# Altium schematic sheet 5_can.SchDoc
size A4; SheetNumber: 5; SheetTotal: 6
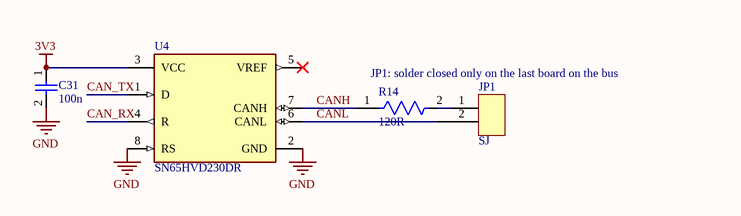
[diagram p0: 5_can.SchDoc]

## Parts
C31  100n  [RES_0603]
JP1  SJ  [SJ_2P]
R14  120R  [RES_0603]
U4  SN65HVD230DR  [FP-D0008A-MFG]

## Nets
3V3: C31.1 U4.3(VCC)
GND: C31.2 U4.2(GND) U4.8(RS)
CAN_RX: U4.4(R)
CAN_TX: U4.1(D)
CANH: R14.1 U4.7(CANH)
CANL: JP1.2 U4.6(CANL)
NetJP1_1: JP1.1 R14.2

Not connected (* = marked no-connect by the designer): U4 5(VREF)*

## Notes on the sheet
- JP1: solder closed only on the last board on the bus

## Library data of the parts
C31 = CAP_0603: Capacitor, 0603; Value: 100n
JP1 = SJ_2P: Solder jumper, 2-pad, open
R14 = RES_0603: Resistor, 0603; Value: 120R
U4 = SN65HVD230DR: IC TRANSCEIVER HALF 1/1 8SOIC; Number of Transceivers: 1; Operating Supply Voltage: 3.3V; Number of I/Os: 2; Max Supply Current: 17mA; Max Supply Voltage: 3.6V; Min Supply Voltage: 3V; Data Rate: 1Mbps; Min Operating Temperature: -40°C; Packaging: Tape and Reel; Lead Free: Lead Free; Number of Transmit Buffers: 1; Max Operating Temperature: 85°C; Number of Receive Buffers: 1; Number of Pins: 8; Package Quantity: 1; Radiation Hardening: No; Case/Package: D; REACH SVHC: No SVHC; Weight: 0.002561oz; Termination: SMD/SMT; Contact Plating: Gold; Nominal Supply Current: 17mA; Number of Receivers: 1; Number of Drivers: 1